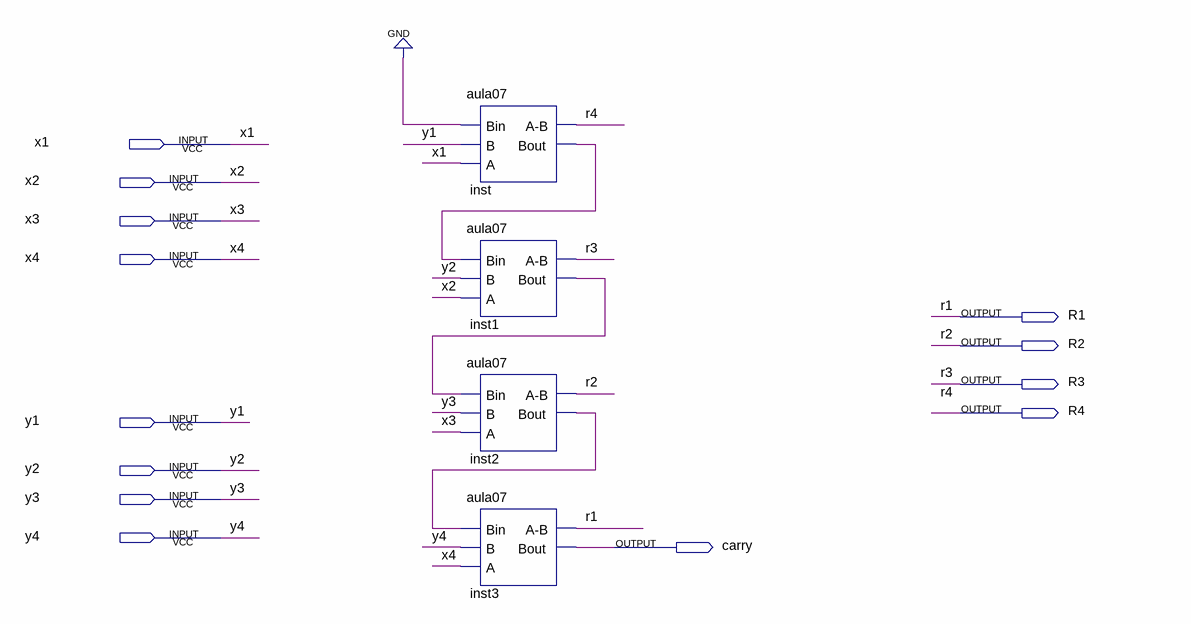
[diagram p0: schematic sheet]
// Quartus schematic subtrator4.bdf as structural Verilog: 4 symbols, 13 pins
module subtrator4 (
  input  x1,
  input  x2,
  input  x3,
  input  x4,
  input  y1,
  input  y2,
  input  y3,
  input  y4,
  output R1,
  output R2,
  output R3,
  output R4,
  output carry
);

  wire inst1_bout, inst2_bout, inst_bout;

  aula07 inst (.Bin(1'b0), .B(y1), .A(x1), .\A-B (R4), .Bout(inst_bout));
  aula07 inst1 (.Bin(inst_bout), .B(y2), .A(x2), .\A-B (R3), .Bout(inst1_bout));
  aula07 inst2 (.Bin(inst1_bout), .B(y3), .A(x3), .\A-B (R2), .Bout(inst2_bout));
  aula07 inst3 (.Bin(inst2_bout), .B(y4), .A(x4), .\A-B (R1), .Bout(carry));
endmodule
